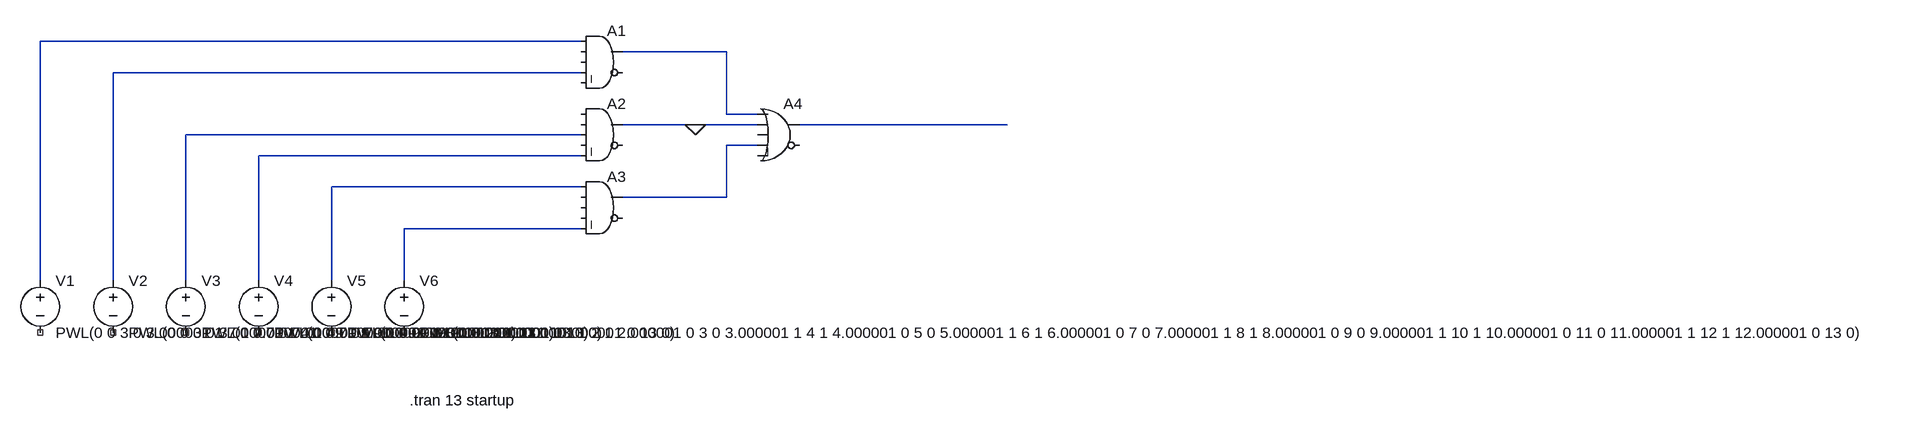
[diagram p0: schematic q48.asc]
q48.asc, the LTspice schematic file:
Version 4.1
SHEET 1 2300 680
WIRE 112 48 -720 48
WIRE 336 64 176 64
WIRE 112 96 -608 96
WIRE 336 160 336 64
WIRE 384 160 336 160
WIRE 288 176 176 176
WIRE 384 176 288 176
WIRE 768 176 448 176
WIRE 112 192 -496 192
WIRE 384 208 336 208
WIRE 112 224 -384 224
WIRE 112 272 -272 272
WIRE 336 288 336 208
WIRE 336 288 176 288
WIRE 112 336 -160 336
WIRE -720 416 -720 48
WIRE -608 416 -608 96
WIRE -496 416 -496 192
WIRE -384 416 -384 224
WIRE -272 416 -272 272
WIRE -160 416 -160 336
FLAG 288 176 0
SYMBOL Digital\\and 144 16 R0
SYMATTR InstName A1
SYMBOL Digital\\and 144 128 R0
SYMATTR InstName A2
SYMBOL Digital\\and 144 240 R0
SYMATTR InstName A3
SYMBOL Digital\\or 416 128 R0
SYMATTR InstName A4
SYMBOL voltage -720 400 R0
WINDOW 123 0 0 Left 0
WINDOW 39 0 0 Left 0
SYMATTR InstName V1
SYMATTR Value PWL(0 0 3 0 3.000001 1 7 1 7.000001 0 9 0 9.000001 1 12 1 12.000001 0 13 0)
SYMBOL voltage -608 400 R0
WINDOW 123 0 0 Left 0
WINDOW 39 0 0 Left 0
SYMATTR InstName V2
SYMATTR Value PWL(0 0 3 0 3.000001 1 4 1 4.000001 0 9 0 9.000001 1 10 1 10.000001 0 13 0)
SYMBOL voltage -496 400 R0
WINDOW 123 0 0 Left 0
WINDOW 39 0 0 Left 0
SYMATTR InstName V3
SYMATTR Value PWL(0 0 7 0 7.000001 1 9 1 9.000001 0 13 0)
SYMBOL voltage -384 400 R0
WINDOW 123 0 0 Left 0
WINDOW 39 0 0 Left 0
SYMATTR InstName V4
SYMATTR Value PWL(0 0 7 0 7.000001 1 8 1 8.000001 0 13 0)
SYMBOL voltage -272 400 R0
WINDOW 123 0 0 Left 0
WINDOW 39 0 0 Left 0
SYMATTR InstName V5
SYMATTR Value PWL(0 0 9 0 9.000001 1 13 1)
SYMBOL voltage -160 400 R0
WINDOW 123 0 0 Left 0
WINDOW 39 0 0 Left 0
SYMATTR InstName V6
SYMATTR Value PWL(0 0 1 0 1.000001 1 2 1 2.000001 0 3 0 3.000001 1 4 1 4.000001 0 5 0 5.000001 1 6 1 6.000001 0 7 0 7.000001 1 8 1 8.000001 0 9 0 9.000001 1 10 1 10.000001 0 11 0 11.000001 1 12 1 12.000001 0 13 0)
TEXT -152 600 Left 2 !.tran 13 startup

The netlist it stands for:
* q48.asc
A1 N001 0 0 N003 0 0 N002 0 AND
A2 0 0 N005 0 N007 0 0 0 AND
A3 N008 0 0 0 N009 0 N006 0 AND
A4 N002 0 0 N006 0 0 N004 0 OR
V1 N001 NC_01 PWL(0 0 3 0 3.000001 1 7 1 7.000001 0 9 0 9.000001 1 12 1 12.000001 0 13 0)
V2 N003 NC_02 PWL(0 0 3 0 3.000001 1 4 1 4.000001 0 9 0 9.000001 1 10 1 10.000001 0 13 0)
V3 N005 NC_03 PWL(0 0 7 0 7.000001 1 9 1 9.000001 0 13 0)
V4 N007 NC_04 PWL(0 0 7 0 7.000001 1 8 1 8.000001 0 13 0)
V5 N008 NC_05 PWL(0 0 9 0 9.000001 1 13 1)
V6 N009 NC_06 PWL(0 0 1 0 1.000001 1 2 1 2.000001 0 3 0 3.000001 1 4 1 4.000001 0 5 0 5.000001 1 6 1 6.000001 0 7 0 7.000001 1 8 1 8.000001 0 9 0 9.000001 1 10 1 10.000001 0 11 0 11.000001 1 12 1 12.000001 0 13 0)
.tran 13 startup
.backanno
.end